# EasyEDA Pro project ProPrj_W_One_V1_01_2026-03-30-22-28-08.epro

# Schematic Schematic1
Board Name: Board1; Create Date: 2026-03-30; Page Name: P1; Project Name: W_One_V1_01; Schematic Name: Schematic1; Update Date: 2026-03-30; Company: EasyEDA.com; Page Size: A4; Version: V1.0
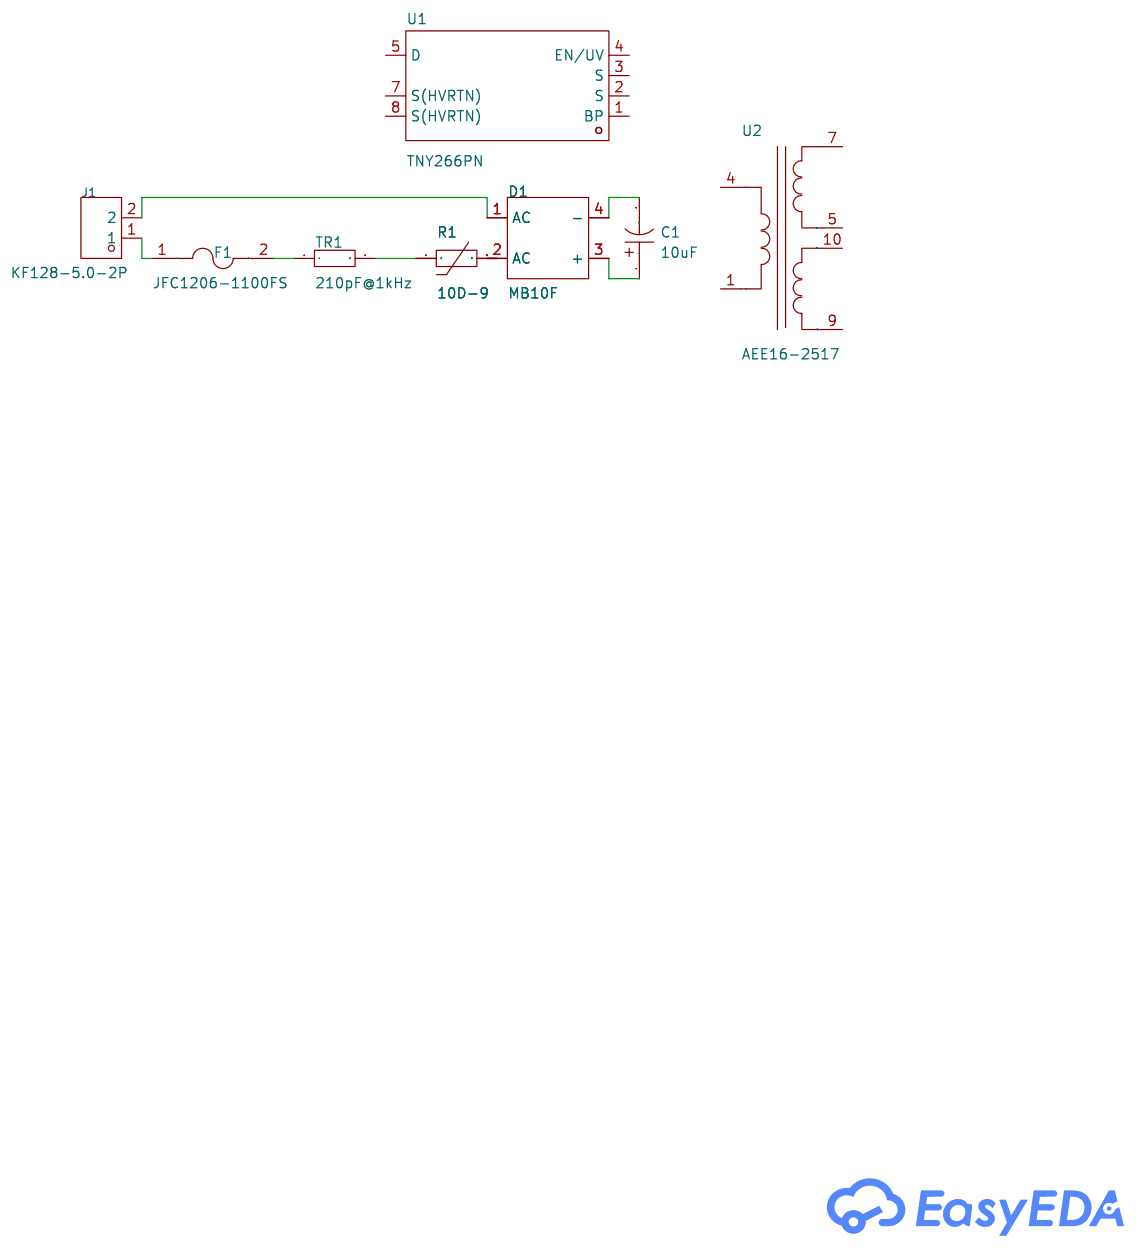
[diagram p0: schematic sheet]

## Parts
C1  10uF  [CAP-TH_BD10.0-P5.00-D0.6-FD_7]
D1  MB10F  [MBF_L4.8-W3.9-P2.50-LS6.7-TL]
F1  JFC1206-1100FS  [F1206]
J1  KF128-5.0-2P  [CONN-TH_P5.00_KF128-5.0-2P]
R1  10D-9  [RES-TH_L11.0-W5.5-P7.50-D0.8-S4.70]
TR1  210pF@1kHz  [RES-TH_L9.0-W6.0-P7.50-D0.6-S5.4]
U1  TNY266PN  [DIP-8_7P-L9.7-W6.4-P2.54-LS7.6-BL-PE6]
U2  AEE16-2517  [XFMR-TH_AEE16-2517]

## Library data of the parts
C1 = 10UF400VG150KM: Capacitance:10uF Tolerance:±20% Tolerance:±20% Voltage Rating:400V Ripple Current:90mA@120Hz Pin Spacing:5mm Diameter:10mm Height - Seated (Max):15mm Lifetime:3000hrs@105℃ Operating Temperature:-25℃~+105℃ Operating Temperature:-25℃~+105℃; LCSC Part Name: 10uF ±20% 400V; Supplier Part: C46867076; Manufacturer: Econd(米朗电子); Supplier Footprint: 插件,D10xL15mm; Datasheet: https://item.szlcsc.com/datasheet/10UF400VG150KM/49031941.html; Supplier: LCSC; Tolerance: ±20%; Voltage Rating: 400V; Ripple Current: 90mA@120Hz; Pin Spacing: 5mm; Diameter: 10mm; Height - Seated (Max): 15mm; Lifetime: 3000hrs@105℃; Operating Temperature: -25℃~+105℃
D1 = MB10F_C7450444: Voltage - Forward(Vf@If):1V@1.0A Voltage - DC Reverse(Vr):1kV Current - Rectified:1A Reverse Leakage Current (Ir):5uA Non-Repetitive Peak Forward Surge Current:65A Operating Junction Temperature Range:-55℃~+150℃ Operating Junction Temperature Range:-55℃~+; LCSC Part Name: 耐压:1000V 电流:1A; Supplier Part: C7450444; Manufacturer: LJ(朗捷); Supplier Footprint: MBF; JLCPCB Part Class: Extended Part; Datasheet: https://item.szlcsc.com/datasheet/MB10F/8475136.html; Supplier: LCSC; Voltage - Forward(Vf@If): 1V@1.0A; Voltage - DC Reverse(Vr): 1kV; Current - Rectified: 1A; Reverse Leakage Current (Ir): 5uA; Non-Repetitive Peak Forward Surge Current: 65A; Operating Junction Temperature Range: -55℃~+150℃; Type: Single-Phase Rectifier
F1 = JFC1206-1100FS: Type:Surface Mount Fuse Current Rating:1A Voltage Rating (AC):- Voltage Rating (DC):63V Operating Temperature:-55℃~+125℃ Operating Temperature:-55℃~+125℃ Melting I2t:0.1 Interrupt Rating:50A Length:3.2mm Width:1.6mm; LCSC Part Name: 贴片式保险丝; Supplier Part: C136343; Manufacturer: JDTfuse(集电通); Supplier Footprint: 1206; JLCPCB Part Class: Extended Part; Datasheet: https://item.szlcsc.com/datasheet/JFC1206-1100FS/147658.html; Supplier: LCSC; Type: Surface Mount Fuse; Current Rating: 1A; Voltage Rating (DC): 63V; Operating Temperature: -55℃~+125℃; Melting I2t: 0.1; Interrupt Rating: 50A; Length: 3.2mm; Width: 1.6mm
J1 = KF128-5.0-2P: Number of Positions or Pins:1x2P Pitch:5mm Color:Green Mounting Type:Through Hole Number of Pins:2P Number of Rows:1 Number of PINs Per Row:2 Current Rating:24A Voltage Rating (Max):250V Wire Gauge - AWG:12~22 Wire Gauge - mm2:2.5 Wire Gauge - mm2:2.5 Ope; LCSC Part Name: 1x2P 5mm 直插 排数:1 每排P数:2; Supplier Part: C474950; Manufacturer: KEFA(科发); Supplier Footprint: 插件,P=5mm; JLCPCB Part Class: Extended Part; Datasheet: https://item.szlcsc.com/datasheet/KF128-5.0-2P/481568.html; Supplier: LCSC; Number of Positions or Pins: 1x2P; Pitch: 5mm; Color: Green; Mounting Type: Through Hole; Number of Pins: 2P; Number of Rows: 1; Number of PINs Per Row: 2; Current Rating: 24A; Voltage Rating (Max): 250V; Wire Gauge - AWG: 12~22; Wire Gauge - mm2: 2.5; Operating Temperature: -40℃~+105℃
R1 = 10D-9_C2839611: Resistance @ 25℃:10Ω B Constant (25℃/50℃):2700K B Constant (25℃/75℃):- B Constant (25℃/85℃):- B Constant (25℃/100℃):- Power(Watts):- B Constant Tolerance:- Steady State Current (Max):2A Operating Temperature:-40℃~+175℃ Operating Temperature:-40℃~+175℃ Dis; LCSC Part Name: 10Ω 2700K MF72功率型热敏电阻; Supplier Part: C2839611; Manufacturer: SURGING(绍鑫); Supplier Footprint: 插件,P=7.5mm; JLCPCB Part Class: Extended Part; Datasheet: https://item.szlcsc.com/datasheet/10D-9/3016794.html; Supplier: LCSC; Resistance @ 25℃: 10Ω; B Constant (25℃/50℃): 2700K; Steady State Current (Max): 2A; Operating Temperature: -40℃~+175℃; Dissipation Factor: 11mW/℃; Pitch: 7.5mm
TR1 = 10D471K: Varistor Voltage:423V~517V Varistor Voltage:423V~517V Clamping Voltage:775V Maximum DC Volts:385V Maximum AC Volts:300V Peak Current:2.5kA Energy:65J Energy:65J Capacitance:210pF@1kHz; LCSC Part Name: 钳位电压775V 65焦耳 插件压敏电阻; Supplier Part: C2839518; Manufacturer: SURGING(绍鑫); Supplier Footprint: 插件,P=7.5mm; JLCPCB Part Class: Extended Part; Datasheet: https://item.szlcsc.com/datasheet/10D471K/3016751.html; Supplier: LCSC; Varistor Voltage: 423V~517V; Clamping Voltage: 775V; Maximum DC Volts: 385V; Maximum AC Volts: 300V; Peak Current: 2.5kA; Energy: 65J
U1 = TNY266PN: Isolation:Isolation Voltage - Supply:- Voltage - Supply:- Frequency - Switching:132kHz Frequency - Switching:132kHz Output Current:- Pd - Power Dissipation:- Duty Cycle(Max):65% Voltage - Breakdown:700V Topology:Flyback Features:Overtemperature protection; LCSC Part Name: 700V; Supplier Part: C24610; Manufacturer: Power Integrations(帕沃英蒂格盛); Supplier Footprint: DIP-8B; JLCPCB Part Class: Extended Part; Datasheet: https://item.szlcsc.com/datasheet/TNY266PN/25351.html; Supplier: LCSC; Isolation: Isolation; Frequency - Switching: 132kHz; Duty Cycle(Max): 65%; Voltage - Breakdown: 700V; Topology: Flyback; Features: Overtemperature protection (OTP)；Short Circuit Protection；Under Voltage Protection；Over Voltage Protection；Over Current Protection; Operating Temperature: -40℃~+150℃@(Tj); Feedback System: Secondary-Side Feedback
U2 = AEE16-2517: Primary Side Voltage:100~400V Isolation Voltage(Vrms):3kV; Supplier Part: C17640705; Manufacturer: Allied Components International; Supplier Footprint: DIP-10P,18.2x16mm; JLCPCB Part Class: Extended Part; Datasheet: https://item.szlcsc.com/datasheet/AEE16-2517/18769965.html; Supplier: LCSC; Primary Side Voltage: 100~400V; Isolation Voltage(Vrms): 3kV

## Nets
$1N147: F1.1 J1.1
$1N309: F1.2 TR1.1
$1N401: R1.1 TR1.2
$1N452: D1.2(AC) R1.2
$1N502: D1.1(AC) J1.2
$1N557: C1.1 D1.3(+)
$1N568: C1.2 D1.4(-)

Not connected (* = marked no-connect by the designer): U1 1(BP) 2(S) 3(S) 4(EN/UV) 5(D) 7(S(HVRTN)) 8(S(HVRTN)); U2 1 4 5 7 9 10

# Board PCB1
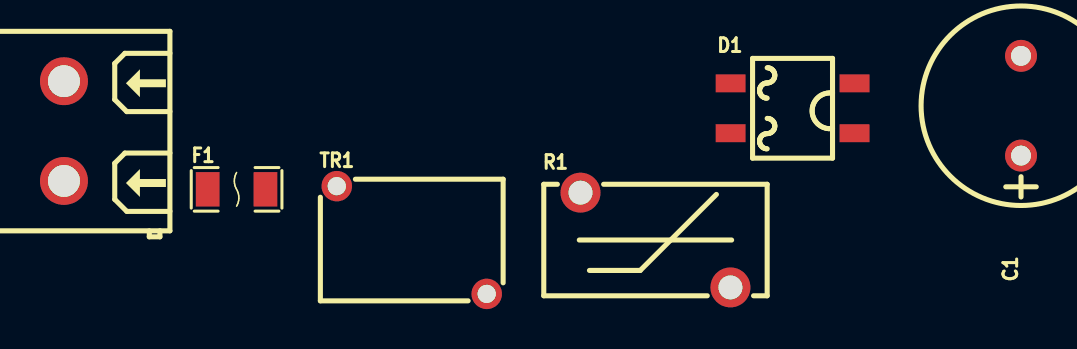
[diagram p1: board, top side]
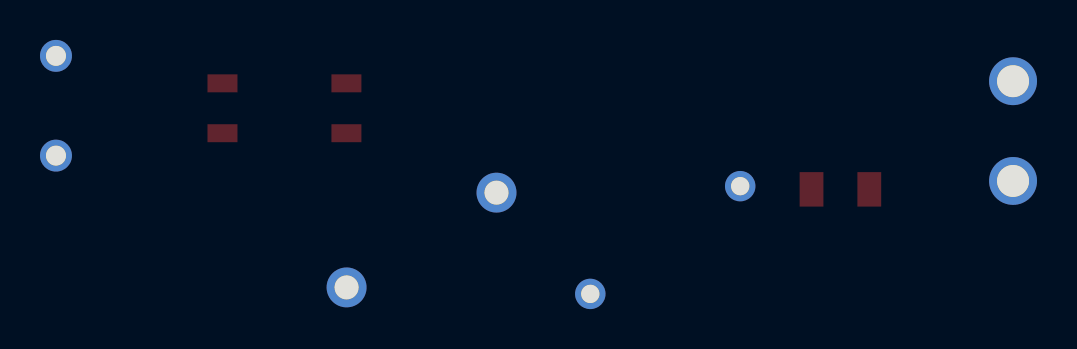
[diagram p2: board, bottom side, seen from below]

No outline. copper layers: Top Layer, Bottom Layer. Coordinates in mm from the lowest, leftmost part position.
Stack: Top Layer 0.035mm / Dielectric1 1.51mm FR4 er 4.5 / Bottom Layer 0.035mm

## Design rules (mm)
template: JLCPCB Capability(Two Layers Board)
spacing copperThickness1oz (default): track to track 0.102, other pairs 0.152 to 0.3
spacing copperThickness2oz: track to track 0.203, other pairs 0.152 to 0.3
track width copperThickness1oz (default): min 0.127, default 0.254, max 2.54
track width copperThickness2oz: min 0.203, default 0.254, max 2.54
differential pair differentialPair (default): width min 0.127, default 0.254, max 2.54; gap min 0.152, default 0.152
via viaSize (default): diameter min 0.5, default 0.61, max 10; hole min 0.3, default 0.305, max 6.3

## Placement (name value [footprint] x y rotation side)
C1  10uF  [CAP-TH_BD10.0-P5.00-D0.6-FD_7]  47.88 6.73 90 top
D1  MB10F  [MBF_L4.8-W3.9-P2.50-LS6.7-TL]  36.45 6.6 0 top
F1  JFC1206-1100FS  [F1206]  8.64 2.54 0 top
J1  KF128-5.0-2P  [CONN-TH_P5.00_KF128-5.0-2P]  0 5.46 90 top
R1  10D-9  [RES-TH_L11.0-W5.5-P7.50-D0.8-S4.70]  29.59 0 0 top
TR1  210pF@1kHz  [RES-TH_L9.0-W6.0-P7.50-D0.6-S5.4]  17.4 0 0 top

## Footprints (pads in the part's own frame, mm; a bottom-side part is the same pattern mirrored in y, then rotated)
CAP-TH_BD10.0-P5.00-D0.6-FD_7
  round 1.6 hole 1: 1(-2.5,0) 2(2.5,0)
CONN-TH_P5.00_KF128-5.0-2P
  round 2.4 hole 1.6: 1(-2.5,0) 2(2.5,0)
F1206
  rect 1.19x1.728 smd: 1(-1.445,0) 2(1.445,0)
MBF_L4.8-W3.9-P2.50-LS6.7-TL
  rect 1.5x0.9 smd: 1(-3.1,1.25) 2(-3.1,-1.25) 3(3.1,-1.25) 4(3.1,1.25)
RES-TH_L9.0-W6.0-P7.50-D0.6-S5.4
  round 1.524 hole 0.914: 1(-3.75,2.7) 2(3.75,-2.7)
RES-TH_L11.0-W5.5-P7.50-D0.8-S4.70
  round 2 hole 1.2: 1(-3.75,2.375) 2(3.75,-2.375)

## Nets
As in the schematic.
